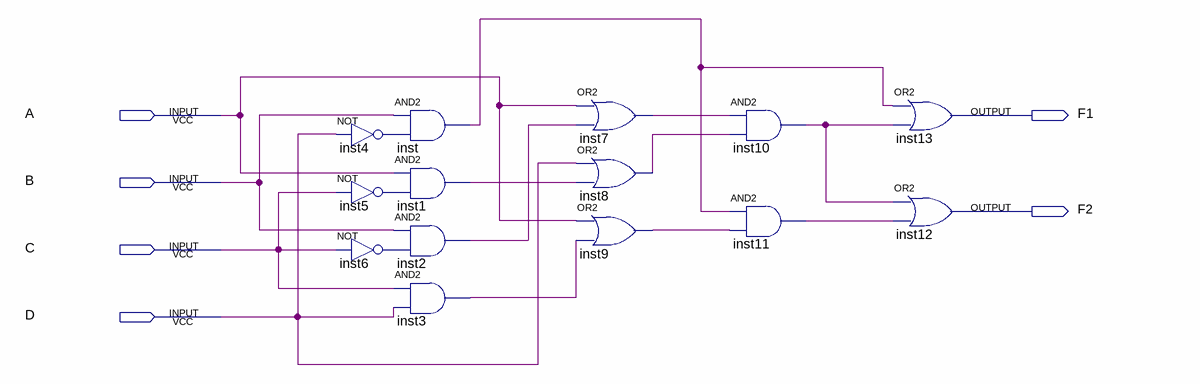
[diagram p0: schematic sheet]
// Quartus schematic Lab2.bdf as structural Verilog: 14 symbols, 6 pins
module Lab2 (
  input  A,
  input  B,
  input  C,
  input  D,
  output F1,
  output F2
);

  wire inst1_out, inst2_out, inst3_out, inst4_out, inst5_out, inst6_out, inst7_out, inst8_out, inst9_out,
       inst10_out, inst11_out, inst_out;

  not inst4 (inst4_out, D);
  not inst5 (inst5_out, C);
  not inst6 (inst6_out, C);
  and inst (inst_out, B, inst4_out);
  and inst1 (inst1_out, A, inst5_out);
  and inst2 (inst2_out, B, inst6_out);
  and inst3 (inst3_out, C, D);
  or inst7 (inst7_out, A, inst2_out);
  or inst8 (inst8_out, D, inst1_out);
  or inst9 (inst9_out, A, inst3_out);
  and inst10 (inst10_out, inst7_out, inst8_out);
  and inst11 (inst11_out, inst_out, inst9_out);
  or inst13 (F1, inst_out, inst10_out);
  or inst12 (F2, inst10_out, inst11_out);
endmodule
